# Altium schematic sheet Top_Sheet.SchDoc
size 420 x 297 mm; SheetNumber: 1; SheetTotal: 5
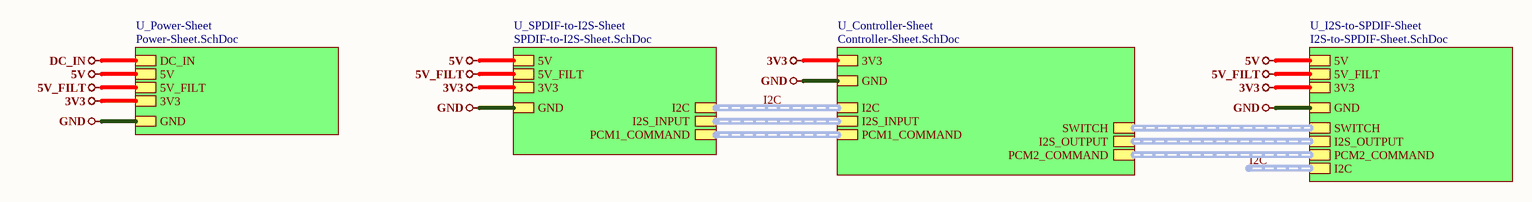
[diagram p0: Top_Sheet.SchDoc]

## Sub-sheets
U_Controller-Sheet = Controller-Sheet.SchDoc: I2S_INPUT (harness I2S_INPUT), I2C (harness I2C), PCM2_COMMAND (harness PCM2_COMMAND), PCM1_COMMAND (harness PCM1_COMMAND), SWITCH (harness SWITCH), I2S_OUTPUT (harness I2S_OUTPUT), 3V3, GND
U_I2S-to-SPDIF-Sheet = I2S-to-SPDIF-Sheet.SchDoc: I2C (harness I2C), PCM2_COMMAND (harness PCM2_COMMAND), 3V3, 5V, GND, 5V_FILT, SWITCH (harness SWITCH), I2S_OUTPUT (harness I2S_OUTPUT)
U_Power-Sheet = Power-Sheet.SchDoc: 3V3, 5V, GND, 5V_FILT, DC_IN
U_SPDIF-to-I2S-Sheet = SPDIF-to-I2S-Sheet.SchDoc: I2C (harness I2C), I2S_INPUT (harness I2S_INPUT), 3V3, 5V, GND, 5V_FILT, PCM1_COMMAND (harness PCM1_COMMAND)

## Nets
3V3: sheet U_Controller-Sheet/3V3, sheet U_I2S-to-SPDIF-Sheet/3V3, sheet U_Power-Sheet/3V3, sheet U_SPDIF-to-I2S-Sheet/3V3
5V: sheet U_I2S-to-SPDIF-Sheet/5V, sheet U_Power-Sheet/5V, sheet U_SPDIF-to-I2S-Sheet/5V
5V_FILT: sheet U_I2S-to-SPDIF-Sheet/5V_FILT, sheet U_Power-Sheet/5V_FILT, sheet U_SPDIF-to-I2S-Sheet/5V_FILT
DC_IN: sheet U_Power-Sheet/DC_IN
GND: sheet U_Controller-Sheet/GND, sheet U_I2S-to-SPDIF-Sheet/GND, sheet U_Power-Sheet/GND, sheet U_SPDIF-to-I2S-Sheet/GND

## Buses and harness runs
harness I2C = sheet U_Controller-Sheet/I2C = sheet U_SPDIF-to-I2S-Sheet/I2C
harness I2C = sheet U_I2S-to-SPDIF-Sheet/I2C
harness sheet U_Controller-Sheet/I2S_INPUT = sheet U_SPDIF-to-I2S-Sheet/I2S_INPUT
harness sheet U_Controller-Sheet/I2S_OUTPUT = sheet U_I2S-to-SPDIF-Sheet/I2S_OUTPUT
harness sheet U_Controller-Sheet/PCM1_COMMAND = sheet U_SPDIF-to-I2S-Sheet/PCM1_COMMAND
harness sheet U_Controller-Sheet/PCM2_COMMAND = sheet U_I2S-to-SPDIF-Sheet/PCM2_COMMAND
harness sheet U_Controller-Sheet/SWITCH = sheet U_I2S-to-SPDIF-Sheet/SWITCH

## Notes on the sheet
- File:
- Title:
- Date:
- Page
- Num:
- Total:
- Drawn By: Huzaifa Ali